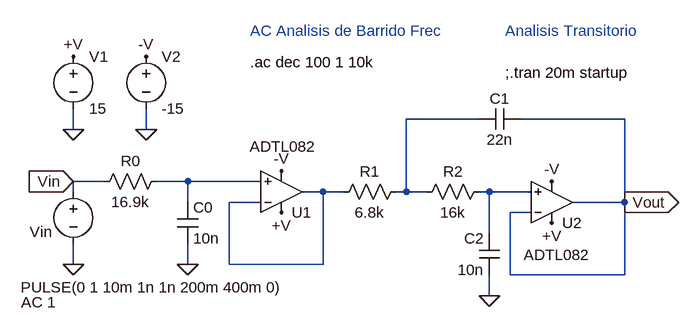
[diagram p0: schematic PasaBajos_Bessel_orden3_IDEAL.asc]
PasaBajos_Bessel_orden3_IDEAL.asc, the LTspice schematic file:
Version 4.1
SHEET 1 880 680
WIRE 448 48 336 48
WIRE 672 48 512 48
WIRE -176 64 -176 32
WIRE -64 64 -64 32
WIRE -128 144 -176 144
WIRE 0 144 -48 144
WIRE 112 144 0 144
WIRE -176 160 -176 144
WIRE 208 160 176 160
WIRE 240 160 208 160
WIRE 336 160 336 48
WIRE 336 160 320 160
WIRE 368 160 336 160
WIRE 464 160 448 160
WIRE 528 160 464 160
WIRE 0 176 0 144
WIRE 112 176 64 176
WIRE 672 176 672 48
WIRE 672 176 592 176
WIRE 528 192 496 192
WIRE 464 224 464 160
WIRE -176 272 -176 240
WIRE 0 272 0 240
WIRE 64 272 64 176
WIRE 208 272 208 160
WIRE 208 272 64 272
WIRE 496 288 496 192
WIRE 672 288 672 176
WIRE 672 288 496 288
WIRE 464 320 464 288
FLAG -176 64 0
FLAG -64 64 0
FLAG -176 -48 +V
FLAG 144 192 +V
FLAG 560 208 +V
FLAG -64 -48 -V
FLAG 144 128 -V
FLAG 560 144 -V
FLAG 0 272 0
FLAG 464 320 0
FLAG 672 176 Vout
IOPIN 672 176 Out
FLAG -176 272 0
FLAG -176 144 Vin
IOPIN -176 144 In
SYMBOL OpAmps\\ADTL082 144 224 M180
WINDOW 3 -49 134 Left 2
SYMATTR InstName U1
SYMBOL OpAmps\\ADTL082 560 240 M180
WINDOW 3 -43 -17 Left 2
SYMATTR InstName U2
SYMBOL voltage -176 -64 R0
WINDOW 123 0 0 Left 0
WINDOW 39 0 0 Left 0
SYMATTR InstName V1
SYMATTR Value 15
SYMBOL voltage -64 -64 R0
WINDOW 123 0 0 Left 0
WINDOW 39 0 0 Left 0
SYMATTR InstName V2
SYMATTR Value -15
SYMBOL res -32 128 R90
WINDOW 0 0 56 VBottom 2
WINDOW 3 32 56 VTop 2
SYMATTR InstName R0
SYMATTR Value 16.9k
SYMBOL cap -16 176 R0
SYMATTR InstName C0
SYMATTR Value 10n
SYMBOL res 336 144 R90
WINDOW 0 0 56 VBottom 2
WINDOW 3 32 56 VTop 2
SYMATTR InstName R1
SYMATTR Value 6.8k
SYMBOL res 464 144 R90
WINDOW 0 0 56 VBottom 2
WINDOW 3 32 56 VTop 2
SYMATTR InstName R2
SYMATTR Value 16k
SYMBOL cap 512 32 R90
WINDOW 0 0 32 VBottom 2
WINDOW 3 32 32 VTop 2
SYMATTR InstName C1
SYMATTR Value 22n
SYMBOL cap 480 288 R180
WINDOW 0 24 56 Left 2
WINDOW 3 24 8 Left 2
SYMATTR InstName C2
SYMATTR Value 10n
SYMBOL voltage -176 144 R0
WINDOW 3 -81 163 Left 2
WINDOW 123 -80 186 Left 2
WINDOW 39 0 0 Left 0
WINDOW 0 -67 78 Left 2
SYMATTR Value PULSE(0 1 10m 1n 1n 200m 400m 0)
SYMATTR Value2 AC 1
SYMATTR InstName Vin
TEXT 96 -40 Left 2 !.ac dec 100 1 10k
TEXT 96 -88 Left 2 ;AC Analisis de Barrido Frec
TEXT 488 -88 Left 2 ;Analisis Transitorio
TEXT 488 -24 Left 2 !;.tran 20m startup

The netlist it stands for:
* PasaBajos_Bessel_orden3_IDEAL.asc
X§U1 N002 N003 +V -V N003 ADTL082  ; pins In+ In- V+ V- OUT
X§U2 N004 Vout +V -V Vout ADTL082  ; pins In+ In- V+ V- OUT
V1 +V 0 15
V2 -V 0 -15
R0 N002 Vin 16.9k
C0 N002 0 10n
R1 N001 N003 6.8k
R2 N004 N001 16k
C1 Vout N001 22n
C2 0 N004 10n
Vin Vin 0 PULSE(0 1 10m 1n 1n 200m 400m 0) AC 1
.ac dec 100 1 10k
* AC Analisis de Barrido Frec
* Analisis Transitorio
;.tran 20m startup
.lib ADI.lib
.backanno
.end